# EasyEDA board Thingyyyy.EasyEDA.epro
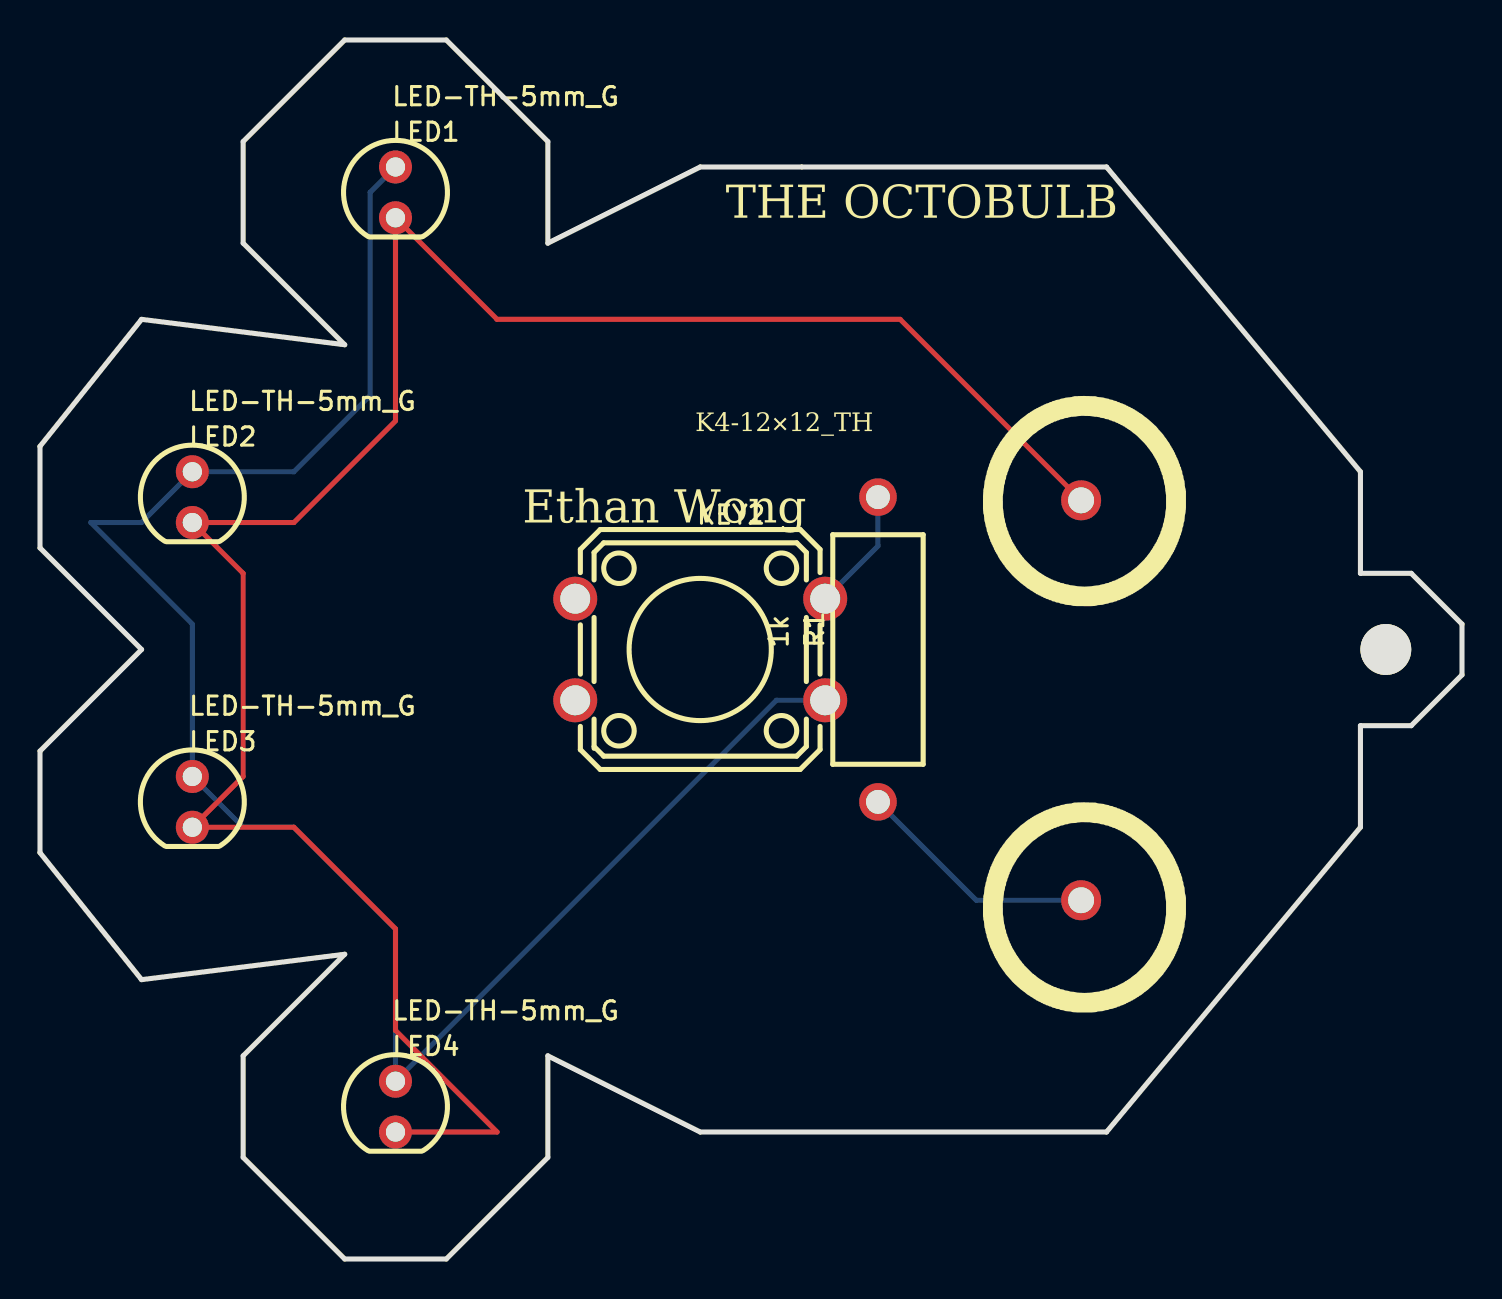
[diagram p0: board, top side]
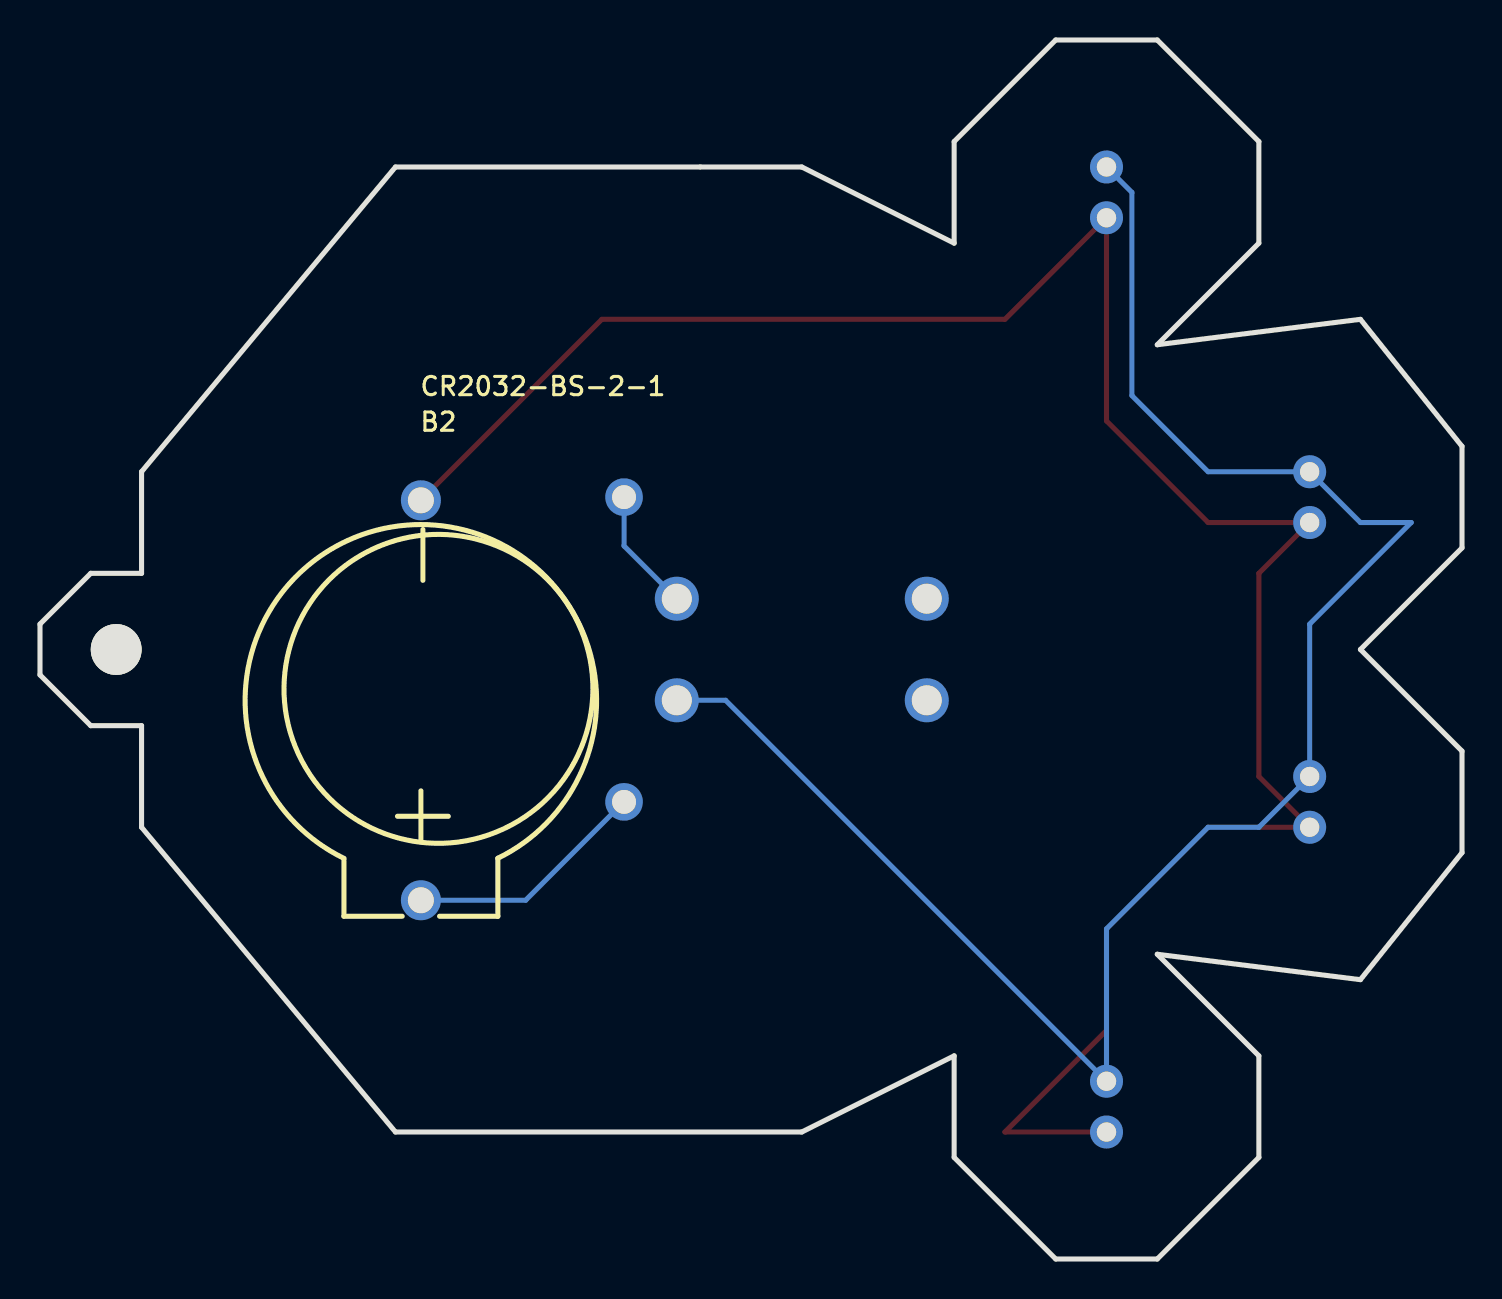
[diagram p1: board, bottom side, seen from below]

Outline 71.12 x 60.96 mm; copper layers: TopLayer, BottomLayer. Coordinates in mm from the lower left corner of the outline.
Outline path: 0,40.64 5.08,46.99 15.24,45.72 10.16,50.8 10.16,55.88 15.24,60.96 20.32,60.96 25.4,55.88 25.4,50.8 33.02,54.61 53.34,54.61 66.04,39.37 66.04,34.29 68.58,34.29 71.12,31.75 71.12,29.21 68.58,26.67 66.04,26.67 66.04,21.59 53.34,6.35 33.02,6.35 25.4,10.16 25.4,5.08 20.32,0 15.24,0 10.16,5.08 10.16,10.16 15.24,15.24 5.08,13.97 0,20.32 0,25.4 5.08,30.48 0,35.56 0,40.64

## Design rules (mm)
Default: track 0.254, clearance 0.152, via 0.61, via hole 0.305

## Placement (name value [footprint] x y rotation side)
B2  CR2032-BS-2-1  [BAT-TH_BS-2-1]  52.07 27.94 180 bottom
Hole_gge885  -  [Hole_gge885]  67.31 30.48 0 top
KEY2  K4-12×12_TH  [KEY-TH_4P-L12.0-W12.0-P5.00-LS12.5]  33.02 30.48 0 top
LED1  LED-TH-5mm_G  [LED-TH_BD5.0_GREEN]  17.78 53.34 0 top
LED2  LED-TH-5mm_G  [LED-TH_BD5.0_GREEN]  7.62 38.1 0 top
LED3  LED-TH-5mm_G  [LED-TH_BD5.0_GREEN]  7.62 22.86 0 top
LED4  LED-TH-5mm_G  [LED-TH_BD5.0_GREEN]  17.78 7.62 0 top
R1  1k  [R_AXIAL-0.6]  41.91 30.48 90 top

## Footprints (pads in the part's own frame, mm; a bottom-side part is the same pattern mirrored in y, then rotated)
BAT-TH_BS-2-1
  oval 2x2 hole 1.3: 1(0,-10) 2(0,10)
Hole_gge885
  round 2.54 hole 2.54 unplated: (0,0)
KEY-TH_4P-L12.0-W12.0-P5.00-LS12.5
  oval 2.2x2.2 hole 1.5: 1(-6.251,2.54) 2(6.251,2.54) 3(-6.251,-2.54) 4(6.251,-2.54)
LED-TH_BD5.0_GREEN
  oval 1.651x1.651 hole 0.965: 1(0,1.27) 2(0,-1.27)
R_AXIAL-0.6
  oval 1.88x1.88 hole 1.199: 1(-7.62,0) 2(7.62,0)

## Nets
B2_2: B2.2 LED1.2 LED2.2 LED3.2 LED4.2
KEY2_1: KEY2.1
KEY2_3: KEY2.3
KEY2_4: KEY2.4 LED1.1 LED2.1 LED3.1 LED4.1
R1_1: B2.1 R1.1
R1_2: KEY2.2 R1.2

## Routing (per net, layer and track width the routed paths; a pad name or vN(x,y) marks a point on that pad's centre or on a via; arc(x,y) is an arc through that point)
B2_2: length 109.5
  TopLayer w0.254: LED4.2 22.86,6.35 17.78,11.43 17.78,16.51 12.7,21.59 LED3.2 10.16,24.13 10.16,34.29 LED2.2 12.7,36.83 17.78,41.91 LED1.2 22.86,46.99 43.02,46.99 B2.2
KEY2_4: length 93.7
  BottomLayer w0.254: LED1.1 16.51,53.34 16.51,43.18 12.7,39.37 LED2.1 5.08,36.83 2.54,36.83 7.62,31.75 LED3.1 10.16,21.59 12.7,21.59 17.78,16.51 LED4.1 36.83,27.94 KEY2.4
R1_1: length 12.2
  BottomLayer w0.254: R1.1 46.83,17.94 B2.1
R1_2: length 6.2
  BottomLayer w0.254: KEY2.2 41.91,35.66 R1.2

## Text on the board
TopSilkLayer: Ethan Wong | THE OCTOBULB
